# Altium project GamingMouse-v1.1.PrjPcb (part 1 of 3)
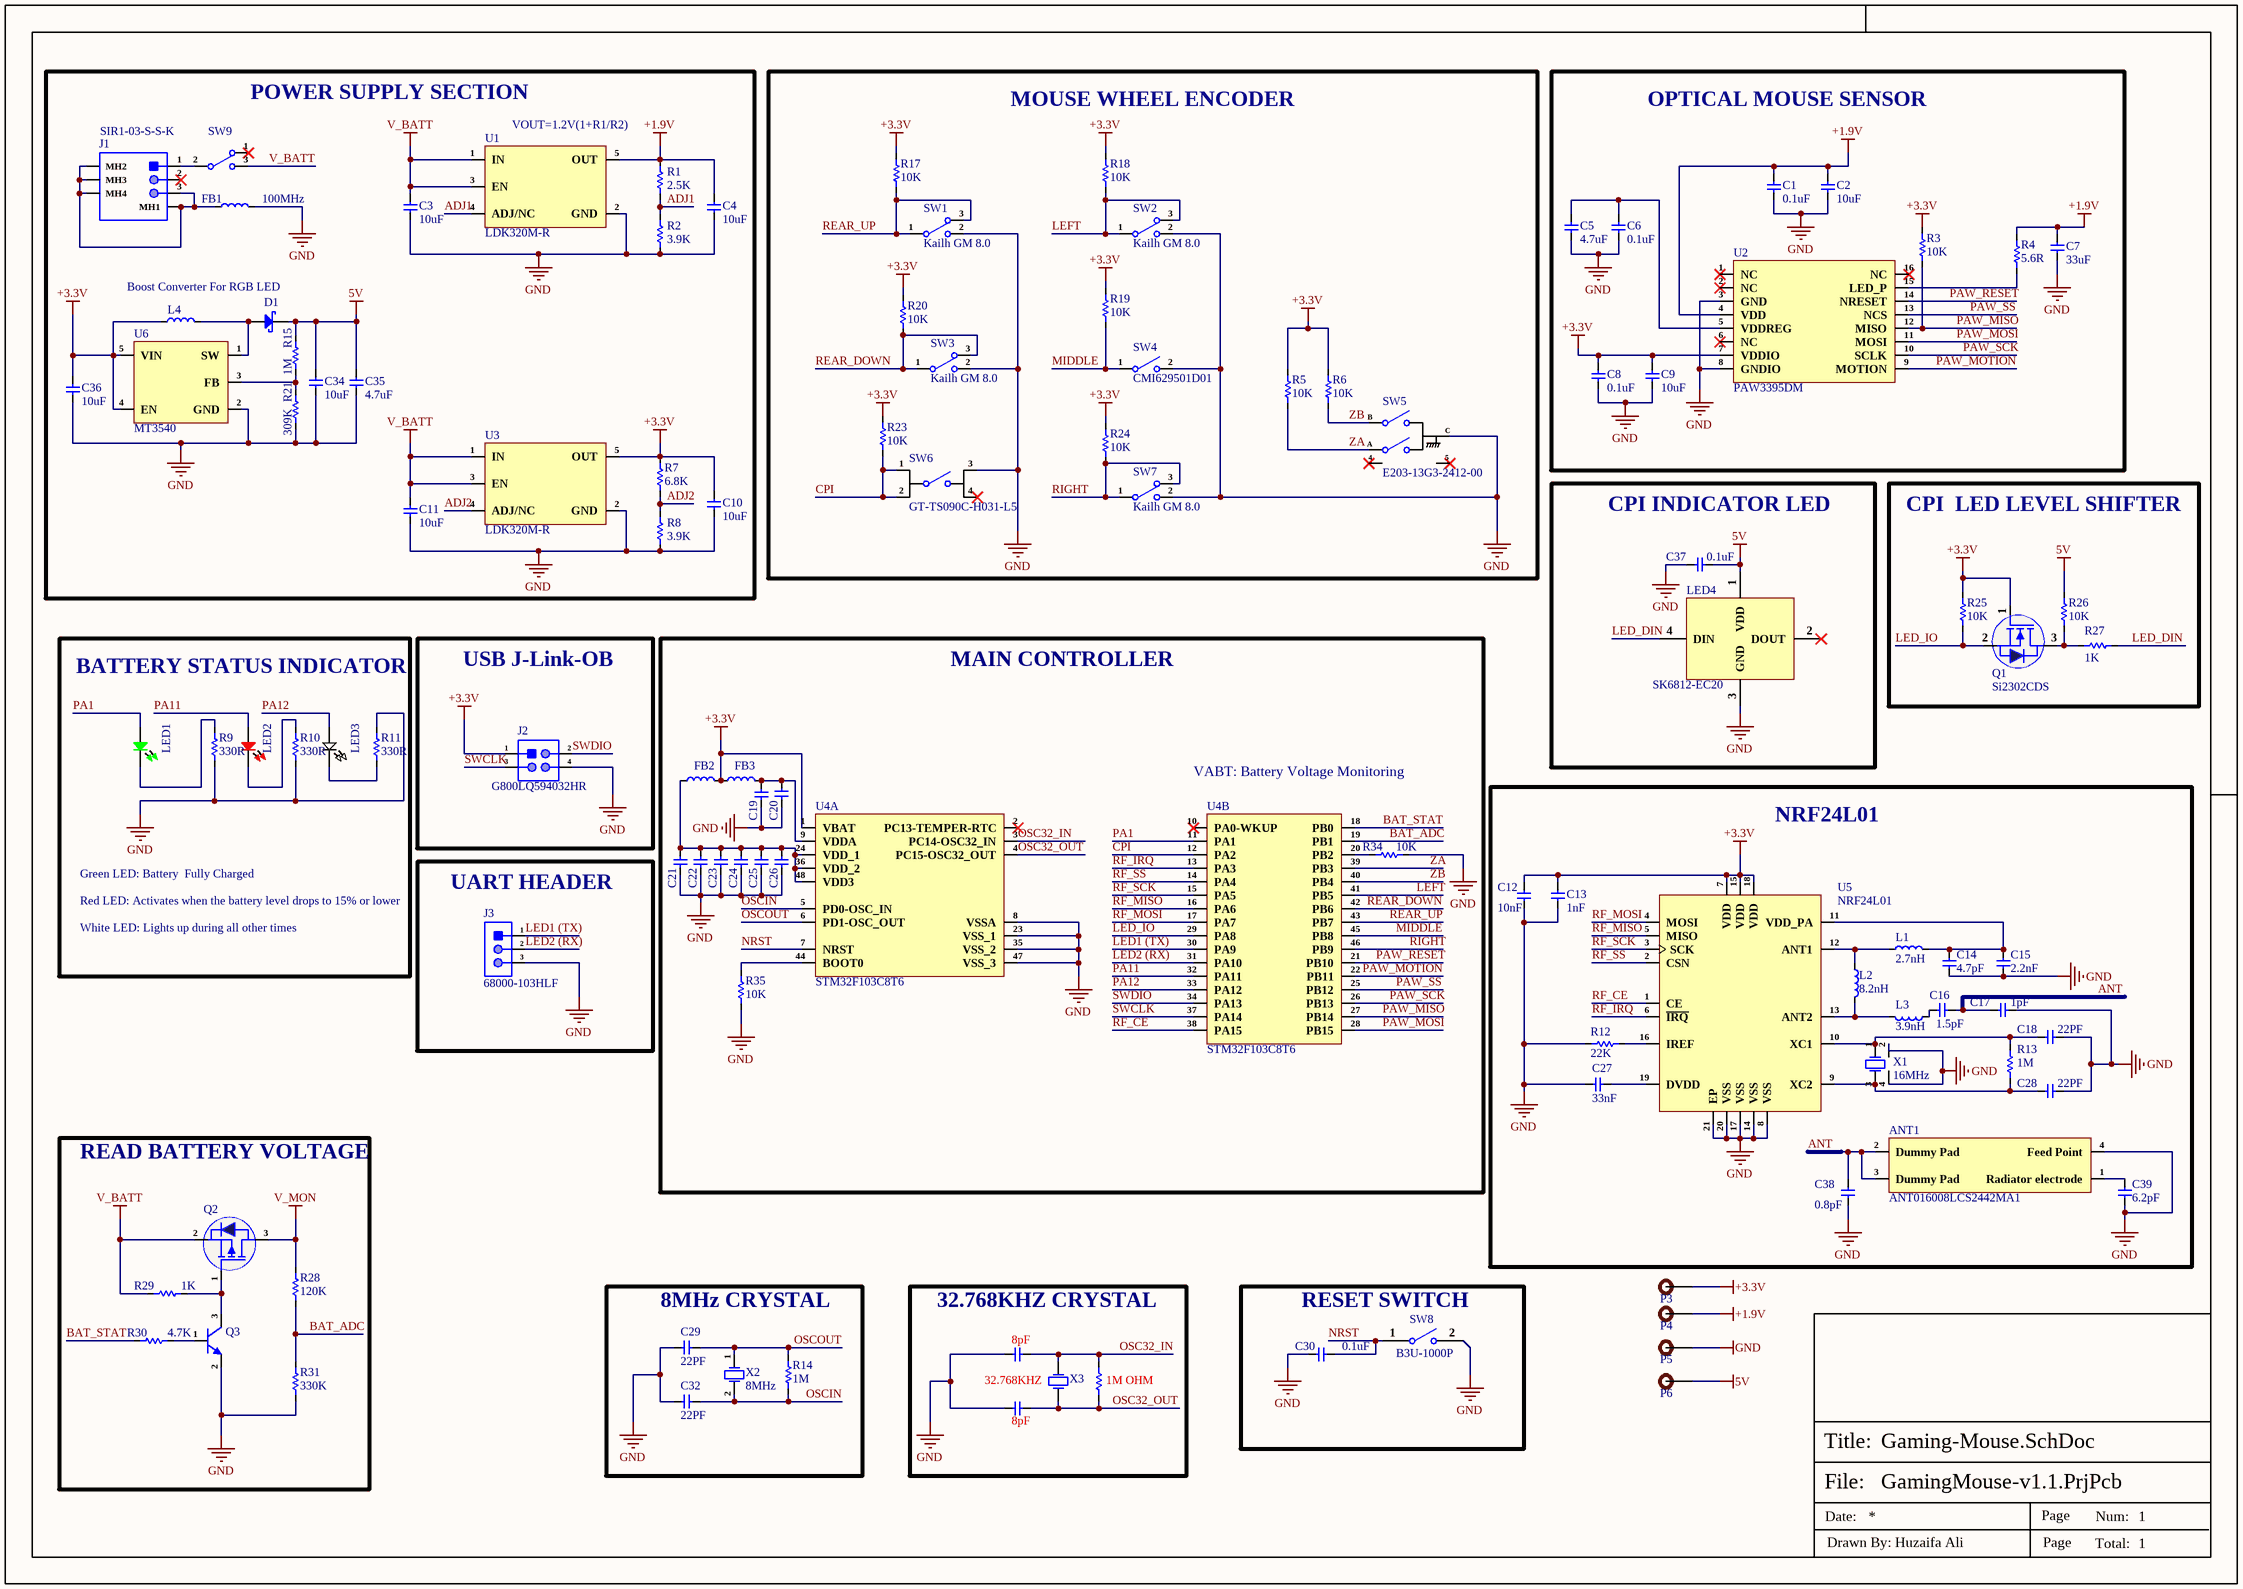
[diagram p0: Gaming-Mouse.SchDoc]
1 sheet, 112 parts. Net scope: global (net labels, ports and power ports of the same name join across sheets).
Board file: GamingMouse-v1.1.PcbDoc

## Sheet Gaming-Mouse.SchDoc
size 420 x 297 mm; SheetNumber: 1; SheetTotal: 1

### Parts
ANT1  ANT016008LCS2442MA1  [ANT016008LCS2442MA1]
C1  0.1uF  [CAP-0201]
C2  10uF  [Cap-0402]
C3  10uF  [Cap-0603]
C4  10uF  [Cap-0603]
C5  4.7uF  [Cap-0603]
C6  0.1uF  [CAP-0201]
C7  33uF  [Cap-0805]
C8  0.1uF  [CAP-0201]
C9  10uF  [Cap-0402]
C10  10uF  [Cap-0603]
C11  10uF  [Cap-0603]
C12  10nF  [Cap-0402]
C13  1nF  [Cap-0402]
C14  4.7pF  [Cap-0402]
C15  2.2nF  [Cap-0402]
C16  1.5pF  [Cap-0402]
C17  1pF  [Cap-0402]
C18  22PF  [Cap-0402]
C19  10nF  [Cap-0402]  (value not drawn)
C20  1uF  [Cap-0402]  (value not drawn)
C21  0.1uF  [Cap-0402]  (value not drawn)
C22  0.1uF  [Cap-0402]  (value not drawn)
C23  0.1uF  [Cap-0402]  (value not drawn)
C24  0.1uF  [Cap-0402]  (value not drawn)
C25  0.1uF  [Cap-0402]  (value not drawn)
C26  4.7uf  [Cap-0402]  (value not drawn)
C27  33nF  [CAP-0201]
C28  22PF  [Cap-0402]
C29  22PF  [Cap-0402]
C30  0.1uF  [Cap-0402]
C31  DNP  [Cap-0402]  (value not drawn)
C32  22PF  [Cap-0402]
C33  DNP  [Cap-0402]  (value not drawn)
C34  10uF  [Cap-0603]
C35  4.7uF  [Cap-0603]
C36  10uF  [Cap-0603]
C37  0.1uF  [Cap-0402]
C38  0.8pF  [CAP-0201]
C39  6.2pF  [CAP-0201]
D1  SSB43L-E3/52T  [SMB_]  (value not drawn)
FB1  100MHz  [IND-0402]
FB2  100MHz  [IND-0402]  (value not drawn)
FB3  100MHz  [IND-0402]  (value not drawn)
J1  SIR1-03-S-S-K  [SIR1-03-S-S-K]
J2  G800LQ594032HR  [HDR 2x2]
J3  68000-103HLF  [HDR1X3_]
L1  2.7nH  [IND-0402]
L2  8.2nH  [IND-0402]
L3  3.9nH  [IND-0402]
L4  DFE322520FD-4R7M=P2  [IND-1210]  (value not drawn)
LED1  Emerald  [LED-0603]  (value not drawn)
LED2  RED  [LED-0603]  (value not drawn)
LED3  White  [LED-0603]  (value not drawn)
LED4  SK6812-EC20  [SK6812-EC20]
P3  TEST POINT 0.5mm Dia  [Test-point - 0.5mm]  (value not drawn)
P4  TEST POINT 0.5mm Dia  [Test-point - 0.5mm]  (value not drawn)
P5  TEST POINT 0.5mm Dia  [Test-point - 0.5mm]  (value not drawn)
P6  TEST POINT 0.5mm Dia  [Test-point - 0.5mm]  (value not drawn)
Q1  Si2302CDS  [Sot-23]
Q2  AO3407  [SOT-23]  (value not drawn)
Q3  MMBT3904M  [SOT-723]  (value not drawn)
R1  2.5K  [Res-0603]
R2  3.9K  [Res-0603]
R3  10K  [Res-0201]
R4  5.6R  [Res-0201]
R5  10K  [Res-0402]
R6  10K  [Res-0402]
R7  6.8K  [Res-0402]
R8  3.9K  [Res-0603]
R9  330R  [Res-0402]
R10  330R  [Res-0402]
R11  330R  [Res-0402]
R12  22K  [Res-0603]
R13  1M  [Res-0402]
R14  1M  [Res-0402]
R15  1M  [Res-0402]
R16  DNP  [Res-0402]  (value not drawn)
R17  10K  [Res-0402]
R18  10K  [Res-0402]
R19  10K  [Res-0402]
R20  10K  [Res-0402]
R21  309K  [Res-0402]
R23  10K  [Res-0402]
R24  10K  [Res-0402]
R25  10K  [Res-0402]
R26  10K  [Res-0402]
R27  1K  [Res-0402]
R28  120K  [Res-0402]
R29  1K  [Res-0402]
R30  4.7K  [Res-0402]
R31  330K  [Res-0402]
R34  10K  [Res-0402]
R35  10K  [Res-0402]
SW1  Kailh GM 8.0  [Kailh GM 8.0]
SW2  Kailh GM 8.0  [Kailh GM 8.0]
SW3  Kailh GM 8.0  [Kailh GM 8.0]
SW4  CMI629501D01  [CMI629501D01]
SW5  E203-13G3-2412-00  [E203-13G3-2412-00]
SW6  GT-TS090C-H031-L5  [GT-TS090C-H031-L5]
SW7  Kailh GM 8.0  [Kailh GM 8.0]
SW8  B3U-1000P  [B3U-1000P]
SW9  CL-SB-12B-02T  [CL-SB-12B-02T]  (value not drawn)
U1  LDK320M-R  [SOT-23-5]
U2  PAW3395DM  [PAW3395DM]
U3  LDK320M-R  [SOT-23-5]
U4  STM32F103C8T6  [48-LQFP (7x7)_]  (parts A,B of 2)
U5  NRF24L01  [20-QFN (4x4)]
U6  MT3540  [SOT-23-5]
X1  16MHz  [SMD3225-4P]
X2  8MHz  [SMD5032-2P]
X3  DNP  [2-SMD, (2.00mm x 1.20mm)]  (value not drawn)

### Blocks framed on the sheet
POWER SUPPLY SECTION: C3 C4 C10 C11 C34-C36 D1 FB1 J1 L4 R1 R2 R7 R8 R15 R21 SW9 U1 U3 U6
MOUSE WHEEL ENCODER: R5 R6 R17-R20 R23 R24 SW1-SW7
OPTICAL MOUSE SENSOR: C1 C2 C5-C9 R3 R4 U2
CPI INDICATOR LED: C37 LED4
CPI  LED LEVEL SHIFTER: Q1 R25-R27
BATTERY STATUS INDICATOR: LED1-LED3 R9-R11
USB J-Link-OB: J2
MAIN CONTROLLER: C19-C26 FB2 FB3 R34 R35 U4
NRF24L01: ANT1 C12-C18 C27 C28 C38 C39 L1-L3 R12 R13 U5 X1
UART HEADER: J3
READ BATTERY VOLTAGE: Q2 Q3 R28-R31
8MHz CRYSTAL: C29 C32 R14 X2
32.768KHZ CRYSTAL: C31 C33 R16 X3
RESET SWITCH: C30 SW8

### Nets
5V: C34.2 C35.2 C37.1 D1.2(K) LED4.1(VDD) P6.1 R15.2 R26.1
+1.9V: C1.2 C2.2 C4.2 C7.2 P4.1 R1.2 R4.2 U1.5(OUT) U2.4(VDD)
+3.3V: C8.2 C9.2 C10.2 C12.2 C13.2 C36.2 FB2.2 FB3.1 J2.1 L4.1 P3.1 Q1.1(G) R3.2 R5.2 R6.2 R7.2 R17.2 R18.2 R19.2 R20.2 R23.2 R24.2 R25.1 U2.7(VDDIO) U3.5(OUT) U4.1(VBAT) U5.7(VDD) U5.15(VDD) U5.18(VDD) U6.4(EN) U6.5(VIN)
GND: ANT1.4(Feed_Point) C1.1 C2.1 C3.1 C4.1 C5.1 C6.1 C7.1 C8.1 C9.1 C10.1 C11.1 C12.1 C13.1 C14.1 C15.1 C17.2 C18.2 C19.1 C20.2 C21.1 C22.1 C23.1 C24.1 C25.1 C26.1 C27.1 C28.2 C29.1 C30.1 C31.1 C32.1 C33.1 C34.1 C35.1 C36.1 C37.2 C38.1 C39.1 FB1.2 J2.4 J3.3 LED4.3(GND) P5.1 Q3.2(E) R2.1 R8.1 R9.1 R10.1 R11.2 R12.1 R21.1 R31.1 R34.2 R35.1 SW1.2(NO) SW2.2(NO) SW3.2(NO) SW4.2 SW5.C SW6.3 SW7.2(NO) SW8.2 U1.2(GND) U2.3(GND) U2.8(GNDIO) U3.2(GND) U4.8(VSSA) U4.23(VSS_1) U4.35(VSS_2) U4.47(VSS_3) U5.8(VSS) U5.14(VSS) U5.17(VSS) U5.20(VSS) U5.21(EP) U6.2(GND) X1.2(GND) X1.4(GND)
V_BATT: C3.2 C11.2 Q2.2(S) R29.1 SW9.3(NO) U1.1(IN) U1.3(EN) U3.1(IN) U3.3(EN)
V_MON: Q2.3(D) R28.2
ADJ1: R1.1 R2.2 U1.4(ADJ/NC)
ADJ2: R7.1 R8.2 U3.4(ADJ/NC)
ANT: ANT1.2(Dummy_Pad) ANT1.3(Dummy_Pad) C16.2 C17.1 C38.2
BAT_ADC: R28.1 R31.2 U4.19(PB1)
BAT_STAT: R30.1 U4.18(PB0)
CPI: R23.1 SW6.1 SW6.2 U4.12(PA2)
LED1 (TX): J3.1 U4.30(PA9)
LED2 (RX): J3.2 U4.31(PA10)
LED_DIN: LED4.4(DIN) R27.2
LED_IO: Q1.2(S) R25.2 U4.29(PA8)
LEFT: R18.1 SW2.1(COM) SW2.3(NC) U4.41(PB5)
MIDDLE: R19.1 SW4.1 U4.45(PB8)
NRST: C30.2 SW8.1 U4.7(NRST)
OSC32_IN: C31.2 R16.2 U4.3(PC14-OSC32_IN) X3.2(OSC2)
OSC32_OUT: C33.2 R16.1 U4.4(PC15-OSC32_OUT) X3.1(OSC1)
OSCIN: C32.2 R14.1 U4.5(PD0-OSC_IN) X2.2(OSC2)
OSCOUT: C29.2 R14.2 U4.6(PD1-OSC_OUT) X2.1(OSC1)
PA1: LED1.1 U4.11(PA1)
PA11: LED2.1 U4.32(PA11)
PA12: LED3.1 U4.33(PA12)
PAW_MISO: R3.1 U2.12(MISO) U4.27(PB14)
PAW_MOSI: U2.11(MOSI) U4.28(PB15)
PAW_MOTION: U2.9(MOTION) U4.22(PB11)
PAW_RESET: U2.14(NRESET) U4.21(PB10)
PAW_SCK: U2.10(SCLK) U4.26(PB13)
PAW_SS: U2.13(NCS) U4.25(PB12)
REAR_DOWN: R20.1 SW3.1(COM) SW3.3(NC) U4.42(PB6)
REAR_UP: R17.1 SW1.1(COM) SW1.3(NC) U4.43(PB7)
RF_CE: U4.38(PA15) U5.1(CE)
RF_IRQ: U4.13(PA3) U5.6(~{IRQ})
RF_MISO: U4.16(PA6) U5.5(MISO)
RF_MOSI: U4.17(PA7) U5.4(MOSI)
RF_SCK: U4.15(PA5) U5.3(SCK)
RF_SS: U4.14(PA4) U5.2(CSN)
RIGHT: R24.1 SW7.1(COM) SW7.3(NC) U4.46(PB9)
SWCLK: J2.3 U4.37(PA14)
SWDIO: J2.2 U4.34(PA13)
ZA: R5.1 SW5.A U4.39(PB3)
ZB: R6.1 SW5.B U4.40(PB4)
NetANT1_1: ANT1.1(Radiator_electrode) C39.2
NetC5_2: C5.2 C6.2 U2.5(VDDREG)
NetC14_2: C14.2 C15.2 L1.2 U5.11(VDD_PA)
NetC16_1: C16.1 L3.2
NetC18_1: C18.1 R13.2 U5.10(XC1) X1.1(OSC1)
NetC19_2: C19.2 C20.1 FB3.2 U4.9(VDDA)
NetC21_2: C21.2 C22.2 C23.2 C24.2 C25.2 C26.2 FB2.1 U4.24(VDD_1) U4.36(VDD_2) U4.48(VDD3)
NetC27_2: C27.2 U5.19(DVDD)
NetC28_1: C28.1 R13.1 U5.9(XC2) X1.3(OSC2)
NetD1_1: D1.1(A) L4.2 U6.1(SW)
NetFB1_1: FB1.1 J1.3 J1.MH1 J1.MH2 J1.MH3 J1.MH4
NetJ1_1: J1.1 SW9.2(COM)
NetL1_1: L1.1 L2.2 U5.12(ANT1)
NetL2_1: L2.1 L3.1 U5.13(ANT2)
NetLED1_2: LED1.2 R9.2
NetLED2_2: LED2.2 R10.2
NetLED3_2: LED3.2 R11.1
NetQ1_3: Q1.3(D) R26.2 R27.1
NetQ2_1: Q2.1(G) Q3.3(C) R29.2
NetQ3_1: Q3.1(B) R30.2
NetR4_1: R4.1 U2.15(LED_P)
NetR12_2: R12.2 U5.16(IREF)
NetR15_1: R15.1 R21.2 U6.3(FB)
NetR34_1: R34.1 U4.20(PB2)
NetR35_2: R35.2 U4.44(BOOT0)

Not connected (* = marked no-connect by the designer): J1 2*; LED4 2(DOUT)*; SW5 4* 5*; SW6 4*; SW9 1(NC)*; U2 1(NC)* 2(NC)* 6(NC)* 16(NC)*; U4 2(PC13-TEMPER-RTC)* 10(PA0-WKUP)*

### Notes on the sheet
- (near U1) VOUT=1.2V(1+R1/R2)
- Boost Converter For RGB LED
- VABT: Battery Voltage Monitoring
- Green LED: Battery  Fully Charged
- Red LED: Activates when the battery level drops to 15% or lower
- White LED: Lights up during all other times
- (near C31) 8pF
- 32.768KHZ
- (near R16) 1M OHM
- (near C33) 8pF
- File:
- Title:
- Date:
- Page
- Num:
- Total:
- Drawn By: Huzaifa Ali